# Altium schematic sheet CLS_1W_3.3V_Lineup.SchDoc
size A3; DocumentNumber: 3; SheetNumber: 3; SheetTotal: 5; Organization: Arribada Initiative; Address1: https://github.com/arribada; Address2: contact@arribada.org; Address3: arribada.org; Address4: UK - Porthmouth
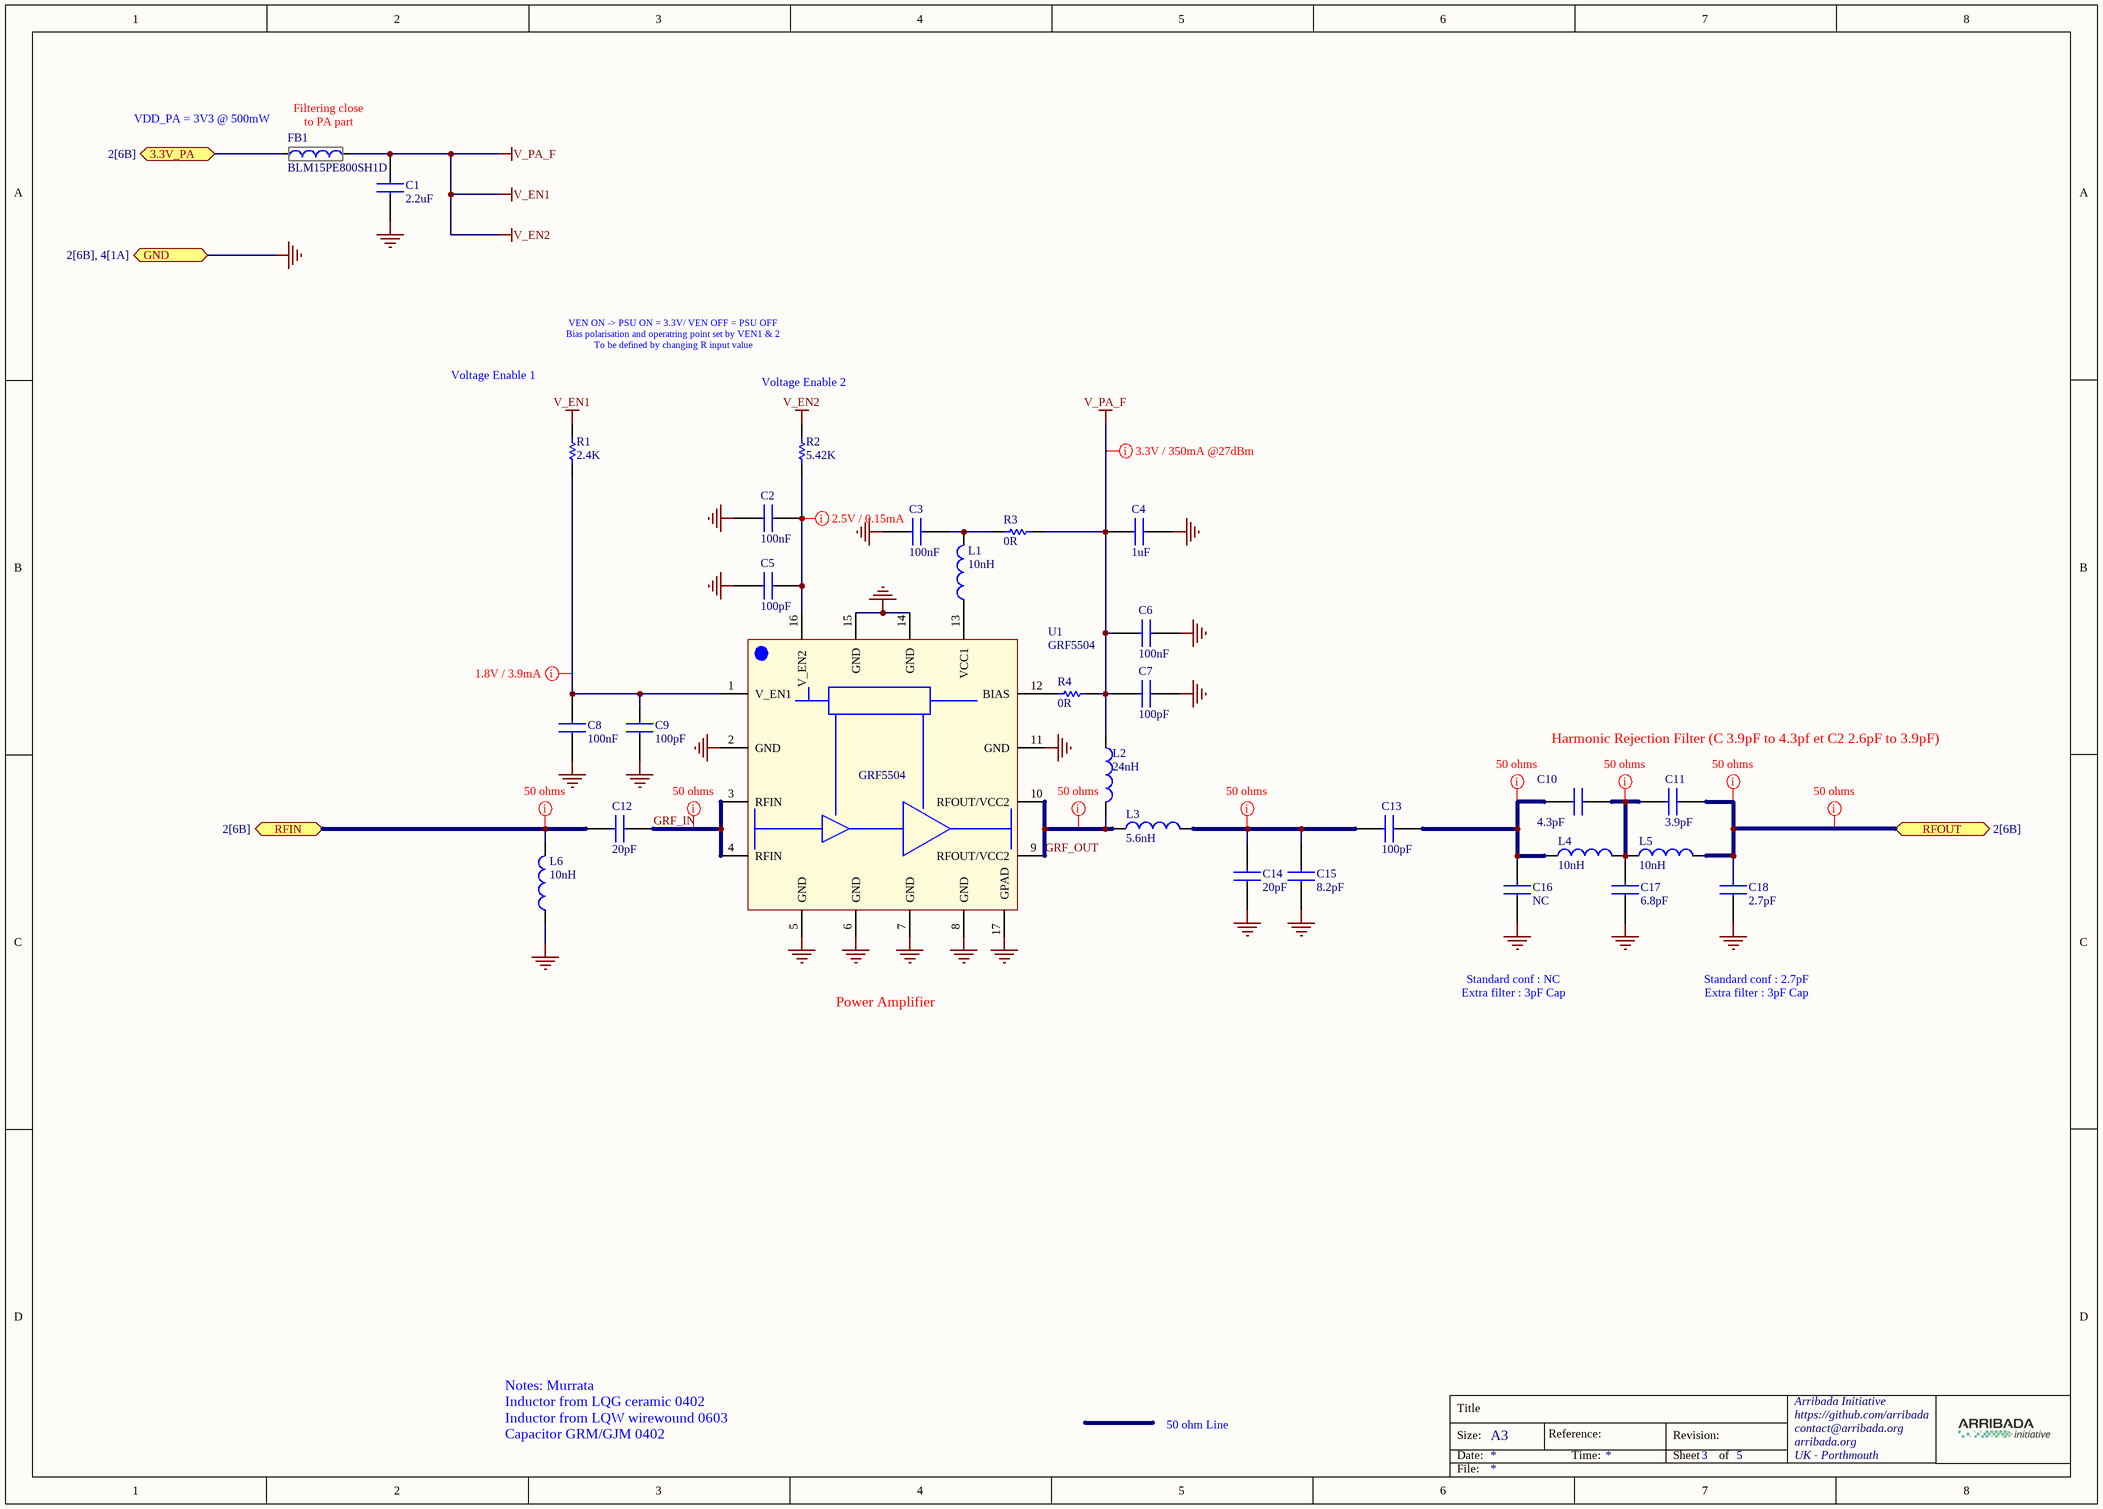
[diagram p0: CLS_1W_3.3V_Lineup.SchDoc]

## Parts
C1  2.2uF  [CAPC1608X09N]
C2  100nF  [CAPC0603X33N]
C3  100nF  [CAPC0603X33N]
C4  1uF  [CAPC1005X55N]
C5  100pF  [CAPC0603X33N]
C6  100nF  [CAPC0603X33N]
C7  100pF  [CAPC0603X33N]
C8  100nF  [CAPC0603X33N]
C9  100pF  [CAPC0603X33N]
C10  Capacitance: 4.3pF  [CAPC1005X55N]  (hidden comment: GRM1555C1H4R3BA01D)
C11  Capacitance: 3.9pF  [CAPC1005X55N]  (hidden comment: GRM1555C1E3R9BA01D)
C12  20pF  [CAPC1005X55N]
C13  Capacitance: 100pF  [CAPC1005X55N]  (hidden comment: GCM1555C1H101JA16D)
C14  20pF  [CAPC1005X55N]
C15  value 8.2pF  [CAPC1005X55N]  (hidden comment: GCM1555C1H8R2CA16J)
C16  value NC  [CAPC1005X55N]  (hidden comment: CAP-NC-0402)
C17  Capacitance: 6.8pF  [CAPC1005X55N]  (hidden comment: GRM1555C1E6R8BA01D)
C18  Capacitance: 2.7pF  [CAPC1005X55N]  (hidden comment: GRM1555C2A2R7CA01D)
FB1  BLM15PE800SH1D  [BLM18EG121SH1D]
L1  10nH  [LQG15WH0N7B02D]
L2  24nH  [LQW18AN10NG80D]
L3  value 5.6nH  [LQW18AN10NG80D]  (hidden comment: LQW18AN5N6C80D)
L4  10nH  [LQW18AN10NG80D]
L5  10nH  [LQW18AN10NG80D]
L6  10nH  [LQG15WH0N7B02D]
R1  2.4K  [RESC1005X40N]
R2  5.42K  [RESC1005X40N]
R3  0R  [RESC1005X40N]
R4  0R  [RESC1005X40N]
U1  GRF5504  [QFN-16_3MM_GRF]

## Ports
3.3V_PA (bidir, see 2[6B]), GND (bidir, see 2[6B], 4[1A]), RFIN (bidir, see 2[6B]), RFOUT (bidir, see 2[6B])

## Nets
GND: C1.1 C2.2 C3.2 C4.2 C5.2 C6.2 C7.2 C8.1 C9.1 C14.2 C15.1 C16.1 C17.1 C18.1 L6.1 U1.2(GND) U1.5(GND) U1.6(GND) U1.7(GND) U1.8(GND) U1.11(GND) U1.14(GND) U1.15(GND) U1.17(GPAD) ; port GND
V_EN1: C1.2 C4.1 C6.1 C7.1 FB1.2 L2.1 R1.2 R2.2 R3.2 R4.2  [also labelled V_EN2, V_PA_F]
3.3V_PA: FB1.1 ; port 3.3V_PA
GRF_IN: C12.2 U1.3(RFIN) U1.4(RFIN)
GRF_OUT: L2.2 L3.1 U1.9(RFOUT/VCC2) U1.10(RFOUT/VCC2)
RFIN: C12.1 L6.2 ; port RFIN
RFOUT: C11.2 C18.2 L5.2 ; port RFOUT
NetC2_1: C2.1 C5.1 R2.1 U1.16(V_EN2)
NetC3_1: C3.1 L1.2 R3.1
NetC8_2: C8.2 C9.2 R1.1 U1.1(V_EN1)
NetC10_1: C10.1 C13.2 C16.2 L4.1
NetC10_2: C10.2 C11.1 C17.2 L4.2 L5.1
NetC13_1: C13.1 C14.1 C15.2 L3.2
NetL1_1: L1.1 U1.13(VCC1)
NetR4_1: R4.1 U1.12(BIAS)

## Layout directives
net class GR_EN: NetC2_1, NetC8_2, V_EN1
net class 50Ohms; rule Impedance Constraint [Min = 50.00    Max = 50.00    ]: GRF_IN, GRF_OUT, NetC10_1, NetC10_2, NetC13_1, RFIN, RFOUT

## Notes on the sheet
- (near FB1) VDD_PA = 3V3 @ 500mW
- (near FB1) Filtering close to PA part
- Voltage Enable 1
- VEN ON -> PSU ON = 3.3V/ VEN OFF = PSU OFF
  Bias polarisation and operatring point set by VEN1 & 2
  To be defined by changing R input value
- (near R2) Voltage Enable 2
- Harmonic Rejection Filter (C 3.9pF to 4.3pf et C2 2.6pF to 3.9pF)
- Standard conf : NC
  Extra filter : 3pF Cap 0402
- Standard conf : 2.7pF
  Extra filter : 3pF Cap 0402
- Power Amplifier
- Notes: Murrata
  Inductor from LQG ceramic 0402
  Inductor from LQW wirewound 0603
  Capacitor GRM/GJM 0402
- 50 ohm Line
- Title
- Size:
- Date:
- A3
- Reference:
- Time:
- Revision:
- Sheet
- of
- File:

## Library data of the parts
C1 = GRM188R71A225KE15D: Multilayer Ceramic Capacitors MLCC - SMD/SMT 2.2 uF 10 VDC 10% 0603 X7R; Manufacturer 1: Murata; Description 1: CAP CER 2.2UF 10V X7R 0603; Voltage Rating: 10V; Supplier 1: Mouser; Supplier Part Number 1: 81-GRM188R71A225KE15; Manufacturer Part Number 1: GRM188R71A225KE15D; RoHS 1: Yes; Category 1: Ceramic Capacitors; Stock 1: 404767; Pricing 1: 1=0,16, 10=0,074, 50=0,074, 100=0,043, 1000=0,034, 10000=0,027 (USD); Mount: Surface Mount; Case/Package: 0603; Case Code (Metric): 1608; Case Code (Imperial): 0603; Weight: 0.000222oz; Min Operating Temperature: -55°C; Max Operating Temperature: 125°C; Package Quantity: 4000; Capacitance: 2.2uF; Tolerance: 10%; Packaging: Cut Tape; Dielectric: X7R; Termination: Standard; Series: GRM; Voltage Rating (DC): 10V; Voltage: 10V; Length: 1.6mm; Width: 0.8mm; Height: 0.8mm; Lead Free: Lead Free; RoHS Compliant: Yes; ComponentLink1URL: https://datasheet.ciiva.com/11789/0900766b80ef921d-11789118.pdf?src-supplier=Rs; ComponentLink1Description: https://datasheet.ciiva.com/11789/0900766b80ef921d-11789118.pdf?src-supplier=Rs; ComponentLink2URL: https://datasheet.ciiva.com/22703/1697709-22703330.pdf?src-supplier=Element14; ComponentLink2Description: https://datasheet.ciiva.com/22703/1697709-22703330.pdf?src-supplier=Element14; ComponentLink3URL: https://datasheet.ciiva.com/138/product-138560.pdf?src-supplier=Digi-Key; ComponentLink3Description: https://datasheet.ciiva.com/138/product-138560.pdf?src-supplier=Digi-Key; ComponentLink4URL: https://datasheet.ciiva.com/138/grm188r71a225ke15-01-138559.pdf?src-supplier=Digi-Key; ComponentLink4Description: https://datasheet.ciiva.com/138/grm188r71a225ke15-01-138559.pdf?src-supplier=Digi-Key; ComponentLink5URL: https://datasheet.ciiva.com/3778/302grm188r71a225ke1523-3778402.pdf?src-supplier=Arrow+Electronics; ComponentLink5Description: https://datasheet.ciiva.com/3778/302grm188r71a225ke1523-3778402.pdf?src-supplier=Arrow+Electronics; ComponentLink6URL: https://datasheet.ciiva.com/29199/454488-da-01-en-vs-kondensator-0603-29199701.pdf?src-supplier=Conrad; ComponentLink6Description: https://datasheet.ciiva.com/29199/454488-da-01-en-vs-kondensator-0603-29199701.pdf?src-supplier=Conrad; ComponentLink7URL: https://datasheet.ciiva.com/138/grm188r71a225ke15-01-138561.pdf?src-supplier=Digi-Key; ComponentLink7Description: https://datasheet.ciiva.com/138/grm188r71a225ke15-01-138561.pdf?src-supplier=Digi-Key; ComponentLink8URL: https://datasheet.ciiva.com/16389/product-16389723.pdf?src-supplier=Future+Electronics; ComponentLink8Description: https://datasheet.ciiva.com/16389/product-16389723.pdf?src-supplier=Future+Electronics; Value: 2.2uF
C2 C3 C6 C8 = GRM033Z71C104KE14D: Multilayer Ceramic Capacitors MLCC - SMD/SMT .1UF     16V   10%        0201; Manufacturer_Name: Murata Electronics; Manufacturer 1: Murata; Geometry.Height: 0.33mm; Description 1: Cap Ceramic 0.1uF 16V X7R 10% Pad SMD 0201 125C T/R; Mouser Part Number: 81-GRM033Z71C104KE4D; Mouser Price/Stock: https://www.mouser.co.uk/ProductDetail/Murata-Electronics/GRM033Z71C104KE14D?qs=lEfY3O89AqkdMqrSfAAk2w%3D%3D; Manufacturer_Part_Number: GRM033Z71C104KE14D; Datasheet Link: http://www.murata.com/~/media/webrenewal/support/library/catalog/products/capacitor/mlcc/c02e.pdf; Supplier 1: Mouser; Supplier Part Number 1: 81-GRM033Z71C104KE4D; Manufacturer Part Number 1: GRM033Z71C104KE14D; RoHS 1: Yes; Category 1: Ceramic Capacitors; Stock 1: 739403; Pricing 1: 1=0,1, 10=0,017, 50=0,017, 100=0,01, 1000=0,008, 10000=0,006 (USD); Case/Package: 0201; RoHS Compliant: Yes
C4 = GRM155Z71A105KE01J: Multilayer Ceramic Capacitors MLCC - SMD/SMT 1.0UF 10V 10% 0402; Manufacturer_Name: Murata Electronics; Manufacturer 1: Murata; Description 1: Multi-Layer Ceramic Capacitor 1uF X7R 10% 0402 Paper T/R; Datasheet Link: http://www.murata.com/~/media/webrenewal/support/library/catalog/products/capacitor/mlcc/c02e.pdf; Height: 0.55mm; Manufacturer_Part_Number: GRM155Z71A105KE01J; Mouser Part Number: 81-GRM155Z71A105KE1J; Mouser Price/Stock: https://www.mouser.co.uk/ProductDetail/Murata-Electronics/GRM155Z71A105KE01J?qs=xZ%2FP%252Ba9zWqaF%2FmyRgV0iOA%3D%3D; Arrow Part Number: GRM155Z71A105KE01J; Arrow Price/Stock: https://www.arrow.com/en/products/grm155z71a105ke01j/murata-manufacturing?region=nac; Supplier 1: Mouser; Supplier Part Number 1: 81-GRM155Z71A105KE1J; Manufacturer Part Number 1: GRM155Z71A105KE01J; RoHS 1: Yes; Category 1: Ceramic Capacitors; Stock 1: 804340; Pricing 1: 1=0,1, 10=0,069, 50=0,069, 100=0,031, 1000=0,018, 10000=0,013 (USD)
C5 C7 C9 = GRM0335C1E101JA01D: Multilayer Ceramic Capacitors MLCC - SMD/SMT 100PF 25V 5% 0201; Manufacturer_Name: Murata Electronics; Manufacturer 1: Murata; Description 1: 0201 100 pF 25 V ±5% Tolerance C0G SMT Multilayer Ceramic Capacitor; Dielectric: C0G; Datasheet Link: http://www.murata.com/~/media/webrenewal/support/library/catalog/products/capacitor/mlcc/c02e.pdf; Height: 0.33mm; Manufacturer_Part_Number: GRM0335C1E101JA01D; Mouser Part Number: 81-GRM0335C1E101JA1D; Mouser Price/Stock: https://www.mouser.co.uk/ProductDetail/Murata-Electronics/GRM0335C1E101JA01D?qs=lsk7mV%2FgRRIhY4z12C%2FxnQ%3D%3D; Arrow Part Number: GRM0335C1E101JA01D; Arrow Price/Stock: https://www.arrow.com/en/products/grm0335c1e101ja01d/murata-manufacturing; Supplier 1: Mouser; Supplier Part Number 1: 81-GRM0335C1E101JA1D; Manufacturer Part Number 1: GRM0335C1E101JA01D; RoHS 1: Yes; Category 1: Ceramic Capacitors; Stock 1: 2143436; Pricing 1: 1=0,1, 10=0,006, 50=0,006, 100=0,004, 1000=0,003, 10000=0,003 (USD); Mount: Surface Mount; Case/Package: 0201; Case Code (Metric): 0603; Case Code (Imperial): 0201; Min Operating Temperature: -55°C; Max Operating Temperature: 125°C; Package Quantity: 1; Packaging: Tape and Reel; Voltage Rating: 25V; Voltage Rating (DC): 25V; Termination: SMD/SMT; Series: GRM; Capacitance: 100pF; Tolerance: 5%; Voltage: 25V; Construction: Flat; Length: 0.6mm; Width: 0.012inch; Depth: 0.3mm; Thickness: 0.013inch; Radiation Hardening: No; Reach SVHC Compliant: No; Lead Free: Lead Free; RoHS Compliant: Yes; ComponentLink1URL: https://datasheet.ciiva.com/16497/grm0335c1e101ja01-01-16497112.pdf?src-supplier=Future+Electronics; ComponentLink1Description: https://datasheet.ciiva.com/16497/grm0335c1e101ja01-01-16497112.pdf?src-supplier=Future+Electronics; ComponentLink2URL: https://datasheet.ciiva.com/18697/product-18697797.pdf?src-supplier=Digi-Key; ComponentLink2Description: https://datasheet.ciiva.com/18697/product-18697797.pdf?src-supplier=Digi-Key; Value: 100pF
C10 = GRM1555C1H4R3BA01D: Multilayer Ceramic Capacitors MLCC - SMD/SMT 4.3 pF 50 VDC 0.1 pF 0402 C0G (NP0); Manufacturer 1: Murata; Description 1: CAP CER 4.3PF 50V C0G/NP0 0402; Voltage Rating (DC): 50V; Value: 4.3pF; Supplier 1: Digi-Key; Supplier Part Number 1: 490-6243-1-ND; Manufacturer Part Number 1: GRM1555C1H4R3BA01D; RoHS 1: Yes; Category 1: Ceramic Capacitors; Pricing 1: 1=0,1, 10=0,051, 50=0,0278, 100=0,0227, 500=0,01624, 1000=0,01276, 2500=0,0116, 5000=0,01067 (USD); Packaging: Tape and Reel; Package Quantity: 1; Dielectric: C0G; Series: GRM; Length: 1mm; Width: 0.02inch; Thickness: 0.022inch; RoHS Compliant: Yes; ComponentLink1URL: https://datasheet.ciiva.com/6270/grm1555c1h4r1wa01-01-6270851.pdf?src-supplier=Digi-Key; ComponentLink1Description: https://datasheet.ciiva.com/6270/grm1555c1h4r1wa01-01-6270851.pdf?src-supplier=Digi-Key; Stock 1: 166304; Mount: Surface Mount; Case/Package: 0402; Case Code (Metric): 1005; Case Code (Imperial): 0402; Min Operating Temperature: -55°C; Max Operating Temperature: 125°C; Voltage Rating: 50V; Termination: SMD/SMT; Voltage: 50V; Construction: Flat; Height: 0.5mm; Depth: 0.5mm; Radiation Hardening: No; Lead Free: Lead Free; ComponentLink2URL: https://datasheet.ciiva.com/11613/product-11613482.pdf?src-supplier=Avnet; ComponentLink2Description: https://datasheet.ciiva.com/11613/product-11613482.pdf?src-supplier=Avnet; ComponentLink3URL: https://datasheet.ciiva.com/18184/getdatasheetpartid-319930-18184404.pdf?src-supplier=Verical; ComponentLink3Description: https://datasheet.ciiva.com/18184/getdatasheetpartid-319930-18184404.pdf?src-supplier=Verical; ComponentLink4URL: https://datasheet.ciiva.com/6270/partnumbering-e-01-6270857.pdf?src-supplier=Digi-Key; ComponentLink4Description: https://datasheet.ciiva.com/6270/partnumbering-e-01-6270857.pdf?src-supplier=Digi-Key; ComponentLink5URL: https://datasheet.ciiva.com/6270/partnumbering-e-01-6270860.pdf?src-supplier=Digi-Key; ComponentLink5Description: https://datasheet.ciiva.com/6270/partnumbering-e-01-6270860.pdf?src-supplier=Digi-Key
C11 = GRM1555C1E3R9BA01D: Multilayer Ceramic Capacitors MLCC - SMD/SMT 3.9 pF 25 VDC 0.1 pF 0402 C0G (NP0); Manufacturer 1: Murata; Description 1: CAP CER 3.9PF 25V NP0 0402; Voltage Rating: 25V; Value: 3.9pF; Supplier 1: Mouser; Supplier Part Number 1: 81-GRM1555C1E3R9BA1D; Manufacturer Part Number 1: GRM1555C1E3R9BA01D; RoHS 1: Yes; Category 1: Ceramic Capacitors; Stock 1: 18288; Pricing 1: 1=0,1, 10=0,056, 50=0,056, 100=0,026, 1000=0,015, 10000=0,01 (USD); Mount: Surface Mount; Case/Package: 0402; Case Code (Imperial): 0402; Case Code (Metric): 1005; Min Operating Temperature: -55°C; Max Operating Temperature: 125°C; Voltage Rating (DC): 25V; Packaging: Tape and Reel; Package Quantity: 10000; Dielectric: C0G; Termination: SMD/SMT; Series: GRM; Construction: Flat; Length: 1mm; Width: 0.5mm; Height: 0.5mm; Thickness: 0.022inch; Depth: 0.5mm; Radiation Hardening: No; RoHS Compliant: Yes; ComponentLink1URL: https://datasheet.ciiva.com/11613/product-11613797.pdf?src-supplier=Avnet; ComponentLink1Description: https://datasheet.ciiva.com/11613/product-11613797.pdf?src-supplier=Avnet; ComponentLink2URL: https://datasheet.ciiva.com/29538/grm1555c1e3r9ba01-01-29538319.pdf?src-supplier=Digi-Key; ComponentLink2Description: https://datasheet.ciiva.com/29538/grm1555c1e3r9ba01-01-29538319.pdf?src-supplier=Digi-Key
C12 C14 = GRM1555C1H200GA01D: Multilayer Ceramic Capacitors MLCC - SMD/SMT 20 pF 50 VDC 2% 0402 C0G (NP0); Manufacturer 1: Murata; Description 1: 0402 20 pF 50 V ±2% Tolerance C0G SMT Multilayer Ceramic Capacitor; Voltage Rating: 50V; Supplier 1: Mouser; Supplier Part Number 1: 81-GRM1555C1H200GA1D; Manufacturer Part Number 1: GRM1555C1H200GA01D; RoHS 1: Yes; Category 1: Ceramic Capacitors; Stock 1: 88926; Pricing 1: 1=0,12, 10=0,05, 50=0,05, 100=0,029, 1000=0,024, 10000=0,02 (USD); Mount: Surface Mount; Case/Package: 0402; Case Code (Metric): 1005; Case Code (Imperial): 0402; Min Operating Temperature: -55°C; Max Operating Temperature: 125°C; Package Quantity: 1; Tolerance: 2%; Packaging: Tape and Reel; Voltage Rating (DC): 50V; Dielectric: C0G; Termination: SMD/SMT; Voltage: 50V; Series: GRM; Construction: Flat; Length: 1mm; Width: 0.02inch; Height: 0.5mm; Thickness: 0.022inch; Depth: 0.5mm; Radiation Hardening: No; Lead Free: Lead Free; RoHS Compliant: Yes; ComponentLink1URL: https://datasheet.ciiva.com/6270/grm1555c1h200ga01-01-6270705.pdf?src-supplier=Digi-Key; ComponentLink1Description: https://datasheet.ciiva.com/6270/grm1555c1h200ga01-01-6270705.pdf?src-supplier=Digi-Key; ComponentLink2URL: https://datasheet.ciiva.com/11609/product-11609354.pdf?src-supplier=Avnet; ComponentLink2Description: https://datasheet.ciiva.com/11609/product-11609354.pdf?src-supplier=Avnet; ComponentLink3URL: https://datasheet.ciiva.com/6270/partnumbering-e-01-6270710.pdf?src-supplier=Digi-Key; ComponentLink3Description: https://datasheet.ciiva.com/6270/partnumbering-e-01-6270710.pdf?src-supplier=Digi-Key; ComponentLink4URL: https://datasheet.ciiva.com/16440/l0005e-16440550.pdf?src-supplier=Future+Electronics; ComponentLink4Description: https://datasheet.ciiva.com/16440/l0005e-16440550.pdf?src-supplier=Future+Electronics; Capacitance: 20pF; Value: 20pF
C13 = GCM1555C1H101JA16D: Multilayer Ceramic Capacitors MLCC - SMD/SMT 100 pF 50 VDC 5% 0402 C0G (NP0) AEC-Q200; Manufacturer 1: Murata; Description 1: 0402 100 pF 50 V ±5 % Tolerance C0G SMT Multilayer Ceramic Capacitor; Voltage Rating: 50V; Value: 100pF; Supplier 1: Mouser; Supplier Part Number 1: 81-GCM1555C1H101JA6D; Manufacturer Part Number 1: GCM1555C1H101JA16D; RoHS 1: Yes; Category 1: Ceramic Capacitors; Stock 1: 5688; Pricing 1: 1=0,1, 10=0,023, 50=0,023, 100=0,014, 1000=0,011, 10000=0,006 (USD); Mount: Surface Mount; Case/Package: 0402; Case Code (Metric): 1005; Case Code (Imperial): 0402; Weight: 0.000212oz; Min Operating Temperature: -55°C; Max Operating Temperature: 125°C; Tolerance: 5%; Packaging: Tape and Reel; Dielectric: C0G; Voltage: 50V; Termination: SMD/SMT; Voltage Rating (DC): 50V; Package Quantity: 10000; Series: GCM; Length: 1mm; Width: 0.02inch; Height: 0.5mm; Thickness: 0.022inch; Depth: 0.5mm; Ratings: AEC-Q200; Radiation Hardening: No; Reach SVHC Compliant: No; Lead Free: Lead Free; RoHS Compliant: Yes; ComponentLink1URL: https://datasheet.ciiva.com/26889/getdatasheetpartid-748988-26889122.pdf?src-supplier=Verical; ComponentLink1Description: https://datasheet.ciiva.com/26889/getdatasheetpartid-748988-26889122.pdf?src-supplier=Verical
C15 = GCM1555C1H8R2CA16J: Multilayer Ceramic Capacitors MLCC - SMD/SMT 8.2 pF 50 VDC 0.25 pF 0402 C0G (NP0) AEC-Q200; Manufacturer 1: Murata; Description 1: Cap Auto-grade 8.2PF 50VDC C0G 0.25PF SMD 0402; Supplier 1: Mouser; Supplier Part Number 1: 81-GCM1555C1H8R2CA6J; Manufacturer Part Number 1: GCM1555C1H8R2CA16J; RoHS 1: Yes; Category 1: Ceramic Capacitors; Stock 1: 93627; Pricing 1: 1=0,1, 10=0,052, 50=0,052, 100=0,024, 1000=0,014, 10000=0,01 (USD); RoHS Compliant: Yes
C16 = CAP-NC-0402: CMS 0402 Non Connected
C17 = GRM1555C1E6R8BA01D: Multilayer Ceramic Capacitors MLCC - SMD/SMT 6.8 pF 25 VDC 0.1 pF 0402 C0G (NP0); Manufacturer 1: Murata; Description 1: Cap 6.8PF 25VDC C0G 0.1PF SMD 0402 Paper Tape; Voltage Rating (DC): 25V; Value: 6.8pF; Supplier 1: Mouser; Supplier Part Number 1: 81-GRM1555C1E6R8BA1D; Manufacturer Part Number 1: GRM1555C1E6R8BA01D; RoHS 1: Yes; Category 1: Ceramic Capacitors; Stock 1: 8888; Pricing 1: 1=0,1, 10=0,035, 50=0,035, 100=0,016, 1000=0,009, 10000=0,006 (USD); Dielectric: C0G; Length: 1mm; Width: 500um; Thickness: 500um; RoHS Compliant: Yes
C18 = GRM1555C2A2R7CA01D: Multilayer Ceramic Capacitors MLCC - SMD/SMT 2.7 pF 100 VDC 0.25 pF 0402 C0G (NP0); Manufacturer 1: Murata; Description 1: Cap Ceramic 2.7pF 100V C0G 0.25pF Pad SMD 0402 125C T/R; Voltage Rating: 100V; Value: 2.7pF; Supplier 1: Mouser; Supplier Part Number 1: 81-GRM1555C2A2R7CA1D; Manufacturer Part Number 1: GRM1555C2A2R7CA01D; RoHS 1: Yes; Category 1: Ceramic Capacitors; Stock 1: 12083; Pricing 1: 1=0,1, 10=0,038, 50=0,038, 100=0,018, 1000=0,01, 10000=0,007 (USD); Mount: Surface Mount; Case/Package: 0402; Case Code (Metric): 1005; Case Code (Imperial): 0402; Weight: 0.000212oz; Min Operating Temperature: -55°C; Max Operating Temperature: 125°C; Package Quantity: 1; Packaging: Tape and Reel; Voltage Rating (DC): 100V; Dielectric: C0G; Termination: SMD/SMT; Series: GRM; Length: 0.039inch; Width: 0.02inch; Height: 0.5mm; Thickness: 0.022inch; RoHS Compliant: Yes; ComponentLink1URL: https://datasheet.ciiva.com/18699/partnumbering-e-01-18699287.pdf?src-supplier=Digi-Key; ComponentLink1Description: https://datasheet.ciiva.com/18699/partnumbering-e-01-18699287.pdf?src-supplier=Digi-Key; ComponentLink2URL: https://datasheet.ciiva.com/18699/partnumbering-e-01-18699288.pdf?src-supplier=Digi-Key; ComponentLink2Description: https://datasheet.ciiva.com/18699/partnumbering-e-01-18699288.pdf?src-supplier=Digi-Key; ComponentLink3URL: https://datasheet.ciiva.com/18699/partnumbering-e-01-18699289.pdf?src-supplier=Digi-Key; ComponentLink3Description: https://datasheet.ciiva.com/18699/partnumbering-e-01-18699289.pdf?src-supplier=Digi-Key; ComponentLink4URL: https://datasheet.ciiva.com/24221/c02e-24221449.pdf?src-supplier=Mouser; ComponentLink4Description: https://datasheet.ciiva.com/24221/c02e-24221449.pdf?src-supplier=Mouser
FB1 = BLM15PE800SH1D: Ferrite Bead, 80 Ohm, 25%, 0402 Rohs Compliant: Yes; Manufacturer 1: Murata; Category 1: Ferrite Beads and Chips; Supplier 1: Digi-Key; Supplier Part Number 1: 490-BLM15PE800SH1DCT-ND; Manufacturer Part Number 1: BLM15PE800SH1D; RoHS 1: No; Description 1: Ferrite Bead, 80 Ohm, 25%, 0402 Rohs Compliant: Yes; Stock 1: 1501; Pricing 1: 1=0,21, 10=0,185, 25=0,1576, 50=0,139, 100=0,1275, 250=0,11588, 500=0,10894, 1000=0,08345, 2500=0,07881 (USD)
L1 L6 = LQG15HS10NJ02D: Inductor RF Chip Multi-Layer 10nH 5% 100MHz 8Q-Factor Air 300mA 260mOhm DCR 0402 Paper T/R; Manufacturer: Murata; Self Resonant Frequency: 3.4GHz; Q Factor: 8; Shielding: Unshielded; DC Resistance (DCR): 260mR; Supplier 1: Arrow Electronics; Manufacturer Part Number: LQG15HS10NJ02D; RoHS: Yes; Category: Fixed Inductors; Stock 1: 211215; Pricing 1: 10000=0,0139 (USD); Mount: Surface Mount; Case/Package: 0402; Core Material: Air; Case Code (Metric): 1005; Case Code (Imperial): 0402; Min Operating Temperature: -55°C; Max Operating Temperature: 125°C; Package Quantity: 1; Packaging: Tape and Reel; Tolerance: 5%; Current Rating: 300mA; Inductance: 10nH; Max DC Current: 300mA; Termination: SMD/SMT; Test Frequency: 100MHz; DC Current: 300mA; Series: LQG15HS; Rated Current-Max: 300mA; Length: 0.039inch; Width: 0.02inch; Height: 0.5mm; Height - Seated (Max): 0.022inch; Depth: 0.55mm; Military Standard: Not; Lead Free: Lead Free; RoHS Compliant: Yes; ComponentLink1URL: https://datasheet.ciiva.com/11801/0900766b80f10809-11801401.pdf?src-supplier=Rs; ComponentLink1Description: https://datasheet.ciiva.com/11801/0900766b80f10809-11801401.pdf?src-supplier=Rs; ComponentLink2URL: https://datasheet.ciiva.com/1038/l0075s0083lqg15hs-1038119.pdf?src-supplier=Digi-Key; ComponentLink2Description: https://datasheet.ciiva.com/1038/l0075s0083lqg15hs-1038119.pdf?src-supplier=Digi-Key; ComponentLink3URL: https://datasheet.ciiva.com/1038/l0075s0083lqg15hs-1038118.pdf?src-supplier=Digi-Key; ComponentLink3Description: https://datasheet.ciiva.com/1038/l0075s0083lqg15hs-1038118.pdf?src-supplier=Digi-Key; ComponentLink4URL: https://datasheet.ciiva.com/1038/l0075s0083lqg15hs-1038120.pdf?src-supplier=Digi-Key; ComponentLink4Description: https://datasheet.ciiva.com/1038/l0075s0083lqg15hs-1038120.pdf?src-supplier=Digi-Key; ComponentLink5URL: https://datasheet.ciiva.com/8510/l0075s0083lqg15hs-8510813.pdf?src-supplier=Avnet; ComponentLink5Description: https://datasheet.ciiva.com/8510/l0075s0083lqg15hs-8510813.pdf?src-supplier=Avnet; Value: 10nH; Supplier Part Number 1: LQG15HS10NJ02D
L2 = LQW18AN24NG80D: Inductor RF Chip Unshielded Wirewound  24nH 2% 100MHz 40Q-Factor Ferrite 1.3A 0603 Paper T/R; Manufacturer 1: Murata; Description 1: Ind RF Chip Unshielded Wirewound 24nH 2% 100MHz 40Q-Factor Ferrite 1.3A 0603 Paper T/R; Category 1: Fixed Inductors; Self Resonant Frequency: 3.45GHz; DC Resistance (DCR): 86mR; Q Factor: 40; Supplier 1: Mouser; Supplier Part Number 1: 81-LQW18AN24NG80D; Manufacturer Part Number 1: LQW18AN24NG80D; RoHS 1: Yes; Stock 1: 13879; Pricing 1: 1=0,21, 10=0,145, 50=0,145, 100=0,117, 1000=0,094, 10000=0,072 (USD); Mount: Surface Mount; Case/Package: 0603; Core Material: Ferrite; Case Code (Metric): 0603; Case Code (Imperial): 1608; Min Operating Temperature: -55°C; Max Operating Temperature: 125°C; Shielding: Unshielded; Packaging: Tape and Reel; Package Quantity: 4000; Inductance: 24nH; Test Frequency: 100MHz; Max DC Current: 1.3A; Termination: SMD/SMT; Tolerance: 2%; Series: LQW18; Current Rating: 1.3A; Length: 0.065inch; Width: 0.8mm; Height: 0.9mm; Height - Seated (Max): 0.039inch; RoHS Compliant: Yes; ComponentLink1URL: http://www.mouser.com/ds/2/281/murata_inductors-1115352.pdf?src-supplier=Mouser; ComponentLink1Description: http://www.mouser.com/ds/2/281/murata_inductors-1115352.pdf?src-supplier=Mouser; ComponentLink2URL: https://search.murata.co.jp/Ceramy/image/img/P02/JELF243A-0102.pdf?src-supplier=Digi-Key; ComponentLink2Description: https://search.murata.co.jp/Ceramy/image/img/P02/JELF243A-0102.pdf?src-supplier=Digi-Key; ComponentLink3URL: http://www.murata.com/~/media/webrenewal/support/library/catalog/products/inductor/chip/o05e.ashx?src-supplier=Digi-Key; ComponentLink3Description: http://www.murata.com/~/media/webrenewal/support/library/catalog/products/inductor/chip/o05e.ashx?src-supplier=Digi-Key; Value: 24nH
L3 = LQW18AN5N6C80D: Inductor Wirewound , 5.6 nH, 40 Milliohm, ± 0.2nH, 6.65 GHz, 1.9 A, 0603 [1608 Metric]; Manufacturer 1: Murata; Description 1: Wirewound Inductor, 5.6 nH, 40 Milliohm, ± 0.2nH, 6.65 GHz, 1.9 A, 0603 [1608 Metric]; Category 1: Fixed Inductors; Core Material: Ferrite; Shielding: Unshielded; Max DC Current: 1.9A; DC Resistance (DCR): 40mR; Q Factor: 38; Test Frequency: 100MHz; Supplier 1: Mouser; Supplier Part Number 1: 81-LQW18AN5N6C80D; Manufacturer Part Number 1: LQW18AN5N6C80D; Stock 1: 5314; Pricing 1: 1=0,22, 10=0,19, 50=0,19, 100=0,128, 1000=0,09, 10000=0,067 (USD); Mount: Surface Mount; Case/Package: 0603; Case Code (Metric): 1608; Case Code (Imperial): 0603; Min Operating Temperature: -55°C; Max Operating Temperature: 125°C; Self Resonant Frequency: 6.65GHz; Packaging: Tape and Reel; Package Quantity: 4000; Inductance: 5.6nH; Termination: SMD/SMT; Series: LQW18; Length: 1.6mm; Width: 0.8mm; Height: 0.9mm; RoHS Compliant: Yes; ComponentLink1URL: http://www.mouser.com/ds/2/281/o05e-522697.pdf?src-supplier=Mouser; ComponentLink1Description: http://www.mouser.com/ds/2/281/o05e-522697.pdf?src-supplier=Mouser; ComponentLink2URL: http://www.murata.com/~/media/webrenewal/support/library/catalog/products/inductor/chip/o05e.ashx?src-supplier=Digi-Key; ComponentLink2Description: http://www.murata.com/~/media/webrenewal/support/library/catalog/products/inductor/chip/o05e.ashx?src-supplier=Digi-Key; ComponentLink3URL: https://datasheet.octopart.com/LQW18AN5N6C80D-Murata-datasheet-142542865.pdf?src-supplier=Ciiva+Crawler; ComponentLink3Description: https://datasheet.octopart.com/LQW18AN5N6C80D-Murata-datasheet-142542865.pdf?src-supplier=Ciiva+Crawler; ComponentLink4URL: https://datasheet.octopart.com/LQW18AN5N6C80D-Murata-datasheet-141294533.pdf?src-supplier=Ciiva+Crawler; ComponentLink4Description: https://datasheet.octopart.com/LQW18AN5N6C80D-Murata-datasheet-141294533.pdf?src-supplier=Ciiva+Crawler; ComponentLink5URL: https://datasheet.octopart.com/LQW18AN5N6C80D-Murata-datasheet-140717965.pdf?src-supplier=Ciiva+Crawler; ComponentLink5Description: https://datasheet.octopart.com/LQW18AN5N6C80D-Murata-datasheet-140717965.pdf?src-supplier=Ciiva+Crawler; ComponentLink6URL: https://datasheet.octopart.com/LQW18AN5N6C80D-Murata-datasheet-138758991.pdf?src-supplier=Ciiva+Crawler; ComponentLink6Description: https://datasheet.octopart.com/LQW18AN5N6C80D-Murata-datasheet-138758991.pdf?src-supplier=Ciiva+Crawler; ComponentLink7URL: https://datasheet.octopart.com/LQW18AN5N6C80D-Murata-datasheet-145452284.pdf?src-supplier=Geoflip; ComponentLink7Description: https://datasheet.octopart.com/LQW18AN5N6C80D-Murata-datasheet-145452284.pdf?src-supplier=Geoflip; ComponentLink8URL: https://datasheet.octopart.com/LQW18AN5N6C80D-Murata-datasheet-142046223.pdf?src-supplier=Arrow.cn; ComponentLink8Description: https://datasheet.octopart.com/LQW18AN5N6C80D-Murata-datasheet-142046223.pdf?src-supplier=Arrow.cn
L4 L5 = LQW18AN10NG80D: Inductor Wirewound , 10 nH, 52 Milliohm, ± 2%, 4.75 GHz, 1.6 A, 0603 [1608 Metric]; Manufacturer 1: Murata; Description 1: Wirewound Inductor, 10 nH, 52 Milliohm, ± 2%, 4.75 GHz, 1.6 A, 0603 [1608 Metric]; Category 1: Fixed Inductors; Core Material: Ferrite; Shielding: Unshielded; Current Rating: 1.6A; DC Resistance (DCR): 52mR; Test Frequency: 100MHz; Q Factor: 38; Supplier 1: Digi-Key; Supplier Part Number 1: 490-17899-1-ND; Manufacturer Part Number 1: LQW18AN10NG80D; Stock 1: 25557; Pricing 1: 1=0,21, 10=0,191, 25=0,1696, 50=0,1442, 100=0,1273, 250=0,11664, 500=0,10604, 1000=0,08908 (USD); Mount: Surface Mount; Case/Package: 0603; Case Code (Metric): 1608; Case Code (Imperial): 0603; Weight: 7.1E-05oz; Min Operating Temperature: -55°C; Max Operating Temperature: 125°C; Self Resonant Frequency: 4.75GHz; Packaging: Tape and Reel; Package Quantity: 4000; Inductance: 10nH; Tolerance: 2%; Max DC Current: 1.6A; Termination: SMD/SMT; Series: LQW18; Length: 0.065inch; Width: 0.99mm; Height: 0.9mm; Height - Seated (Max): 0.039inch; RoHS Compliant: Yes; ComponentLink1URL: http://www.mouser.com/ds/2/281/murata_inductors-1115352.pdf?src-supplier=Mouser; ComponentLink1Description: http://www.mouser.com/ds/2/281/murata_inductors-1115352.pdf?src-supplier=Mouser; ComponentLink2URL: https://search.murata.co.jp/Ceramy/image/img/P02/JELF243A-0102.pdf?src-supplier=Digi-Key; ComponentLink2Description: https://search.murata.co.jp/Ceramy/image/img/P02/JELF243A-0102.pdf?src-supplier=Digi-Key; ComponentLink3URL: http://www.murata.com/~/media/webrenewal/support/library/catalog/products/inductor/chip/o05e.ashx?src-supplier=Digi-Key; ComponentLink3Description: http://www.murata.com/~/media/webrenewal/support/library/catalog/products/inductor/chip/o05e.ashx?src-supplier=Digi-Key; ComponentLink4URL: https://datasheet.octopart.com/LQW18AN10NG80D-Murata-datasheet-142542380.pdf?src-supplier=Ciiva+Crawler; ComponentLink4Description: https://datasheet.octopart.com/LQW18AN10NG80D-Murata-datasheet-142542380.pdf?src-supplier=Ciiva+Crawler; ComponentLink5URL: https://datasheet.octopart.com/LQW18AN10NG80D-Murata-datasheet-141294525.pdf?src-supplier=Ciiva+Crawler; ComponentLink5Description: https://datasheet.octopart.com/LQW18AN10NG80D-Murata-datasheet-141294525.pdf?src-supplier=Ciiva+Crawler; ComponentLink6URL: https://datasheet.octopart.com/LQW18AN10NG80D-Murata-datasheet-140717668.pdf?src-supplier=Ciiva+Crawler; ComponentLink6Description: https://datasheet.octopart.com/LQW18AN10NG80D-Murata-datasheet-140717668.pdf?src-supplier=Ciiva+Crawler; ComponentLink7URL: https://datasheet.octopart.com/LQW18AN10NG80D-Murata-datasheet-138758702.pdf?src-supplier=Ciiva+Crawler; ComponentLink7Description: https://datasheet.octopart.com/LQW18AN10NG80D-Murata-datasheet-138758702.pdf?src-supplier=Ciiva+Crawler; ComponentLink8URL: https://datasheet.octopart.com/LQW18AN10NG80D-Murata-datasheet-145452284.pdf?src-supplier=Geoflip; ComponentLink8Description: https://datasheet.octopart.com/LQW18AN10NG80D-Murata-datasheet-145452284.pdf?src-supplier=Geoflip; ComponentLink9URL: https://datasheet.octopart.com/LQW18AN10NG80D-Murata-datasheet-142046197.pdf?src-supplier=Arrow.cn; ComponentLink9Description: https://datasheet.octopart.com/LQW18AN10NG80D-Murata-datasheet-142046197.pdf?src-supplier=Arrow.cn; ComponentLink10URL: https://datasheet.octopart.com/LQW18AN10NG80D-Murata-datasheet-141404629.pdf?src-supplier=TME; ComponentLink10Description: https://datasheet.octopart.com/LQW18AN10NG80D-Murata-datasheet-141404629.pdf?src-supplier=TME; Value: 10nH
R1 = RC0402FR-132K4L: Thick Film Resistors - SMD 2.4 kOhms 62.5 mW 0402 1%; Manufacturer 1: Yageo; Description 1: Res Thick Film 0402 2.4K Ohm 1% 1/16W ±100ppm/°C Molded SMD SMD Paper T/R; Category 1: Chip SMD Resistors; Resistance: 2.4kR; Temperature Coefficient: 100ppm/°C; Value: 2.4kR; Supplier 1: Mouser; Supplier Part Number 1: 603-RC0402FR-132K4L; Manufacturer Part Number 1: RC0402FR-132K4L; RoHS 1: Yes; Stock 1: 107917; Pricing 1: 1=0,1, 10=0,014, 50=0,014, 100=0,007, 1000=0,004, 10000=0,003 (USD); Case/Package: 0402; Contact Plating: Tin,Matte; Min Operating Temperature: -55°C; Max Operating Temperature: 155°C; Tolerance: 1%; RoHS Compliant: Yes; ComponentLink1URL: https://datasheet.ciiva.com/8894/pyu-rc0402-51-rohs-l-6-8894383.pdf?src-supplier=Avnet; ComponentLink1Description: https://datasheet.ciiva.com/8894/pyu-rc0402-51-rohs-l-6-8894383.pdf?src-supplier=Avnet
R2 = RN73H1ETTP5421F50: Thin Film Resistors - SMD 5.42kOhm,0402,1%,50p pm,63mW,50V; Manufacturer 1: KOA Speer; Description 1: Res 5.42K Ohm 1% 1/16W 0402; Category 1: Chip SMD Resistors; Resistance: 5.42kR; Temperature Coefficient: 50ppm/°C; Value: 5.42kR; Supplier 1: Mouser; Supplier Part Number 1: 660-RN73H1ETP5421F50; Manufacturer Part Number 1: RN73H1ETTP5421F50; RoHS 1: Yes; Stock 1: 7820; Pricing 1: 1=0,26, 10=0,182, 50=0,182, 100=0,127, 1000=0,089, 10000=0,061 (USD); Case/Package: 0402; Case Code (Imperial): 0402; Case Code (Metric): 1005; Weight: 2.3E-05oz; Min Operating Temperature: -55°C; Max Operating Temperature: 155°C; Power Rating: 63mW; Packaging: Tape and Reel; Tolerance: 1%; Voltage Rating: 50V; Termination: SMD/SMT; Voltage Rating (DC): 50V; Series: RN73H; Length: 1mm; Width: 0.5mm; Height: 0.35mm; ComponentLink1URL: https://datasheet.ciiva.com/12788/rn73h-12788712.pdf?src-supplier=Mouser; ComponentLink1Description: https://datasheet.ciiva.com/12788/rn73h-12788712.pdf?src-supplier=Mouser
R3 R4 = CRCW04020000Z0ED: Resistors Thick Film  - SMD 0402 0.063 W 0 Ohm Jumper; Manufacturer 1: Vishay; Description 1: CRCW Series 0402 0.063 W 0 Ohm Jumper Surface Mount Thick Film Chip Resistor; Category 1: Chip SMD Resistors; Resistance: 0mR; Power Rating: 63mW; Voltage Rating: 50V; Temperature Coefficient: 100ppm/°C; Tolerance: 5%; Value: 0mR; Supplier 1: Digi-Key; Supplier Part Number 1: 541-0.0JCT-ND; Manufacturer Part Number 1: CRCW04020000Z0ED; RoHS 1: Yes; Stock 1: 170588; Pricing 1: 1=0,1, 10=0,029, 25=0,0208, 50=0,016, 100=0,0118, 250=0,009, 500=0,0072, 1000=0,0053, 5000=0,0038 (USD); Case/Package: 0402; Case Code (Imperial): 0402; Case Code (Metric): 1005; Contact Plating: Tin; Size Code: 0402; Weight: 2.3E-05oz; Min Operating Temperature: -55°C; Max Operating Temperature: 155°C; Packaging: Tape and Reel; Series: CRCW; Number of Terminations: 2; Max Power Dissipation: 63mW; Termination: SMD/SMT; Package Quantity: 10000; Resistor Type: Thick Film; Voltage Rating (DC): 50V; Features: Automotive AEC-Q200; Construction: Rectangular; Length: 1mm; Width: 0.5mm; Height: 0.35mm; Depth: 0.5mm; Ratings: AEC-Q200; Radiation Hardening: No; RoHS Compliant: Yes; Lead Free: Lead Free; Reach SVHC Compliant: Unknown; Military Standard: Not; ComponentLink1URL: https://datasheet.ciiva.com/3255/dcrcwe3-3255944.pdf?src-supplier=Avnet; ComponentLink1Description: https://datasheet.ciiva.com/3255/dcrcwe3-3255944.pdf?src-supplier=Avnet; ComponentLink2URL: https://datasheet.ciiva.com/3255/dcrcwe3-3255945.pdf?src-supplier=Avnet; ComponentLink2Description: https://datasheet.ciiva.com/3255/dcrcwe3-3255945.pdf?src-supplier=Avnet; ComponentLink3URL: https://datasheet.ciiva.com/2461/dcrcwe3-2461962.pdf?src-supplier=Digi-Key; ComponentLink3Description: https://datasheet.ciiva.com/2461/dcrcwe3-2461962.pdf?src-supplier=Digi-Key; ComponentLink4URL: https://datasheet.ciiva.com/7841/1720486-7841802.pdf?src-supplier=Element14; ComponentLink4Description: https://datasheet.ciiva.com/7841/1720486-7841802.pdf?src-supplier=Element14; ComponentLink5URL: https://datasheet.ciiva.com/2461/dcrcwe3-2461964.pdf?src-supplier=Digi-Key; ComponentLink5Description: https://datasheet.ciiva.com/2461/dcrcwe3-2461964.pdf?src-supplier=Digi-Key; ComponentLink6URL: https://datasheet.ciiva.com/7841/1697337-7841468.pdf?src-supplier=Element14; ComponentLink6Description: https://datasheet.ciiva.com/7841/1697337-7841468.pdf?src-supplier=Element14; ComponentLink7URL: https://datasheet.ciiva.com/16761/70200976-16761309.pdf?src-supplier=Allied+Electronics; ComponentLink7Description: https://datasheet.ciiva.com/16761/70200976-16761309.pdf?src-supplier=Allied+Electronics; ComponentLink8URL: https://datasheet.ciiva.com/26311/fld-crcw-e3-data-en-26311550.pdf?src-supplier=Distrelec; ComponentLink8Description: https://datasheet.ciiva.com/26311/fld-crcw-e3-data-en-26311550.pdf?src-supplier=Distrelec
U1 = GRF5504: RF Amplifier High Efficiency, 3.5Watt PA/Saturated PA, OP1dB >34.0 dBm; 0.4 - 0.5 GHz; Mfr_Name: Guerrilla RF; Description 1: Rf & Mw Power Amplifier; RefDes: RefDes; Type: Type; Supplier 1: Mouser; Supplier Part Number 1: 459-GRF5504; Manufacturer 1: Guerrilla RF; Manufacturer Part Number 1: GRF5504; RoHS 1: No; Stock 1: 2152; Pricing 1: 1=4,41, 10=3,96, 50=3,74, 100=3,25, 1000=2,35, 10000=2,27 (USD)